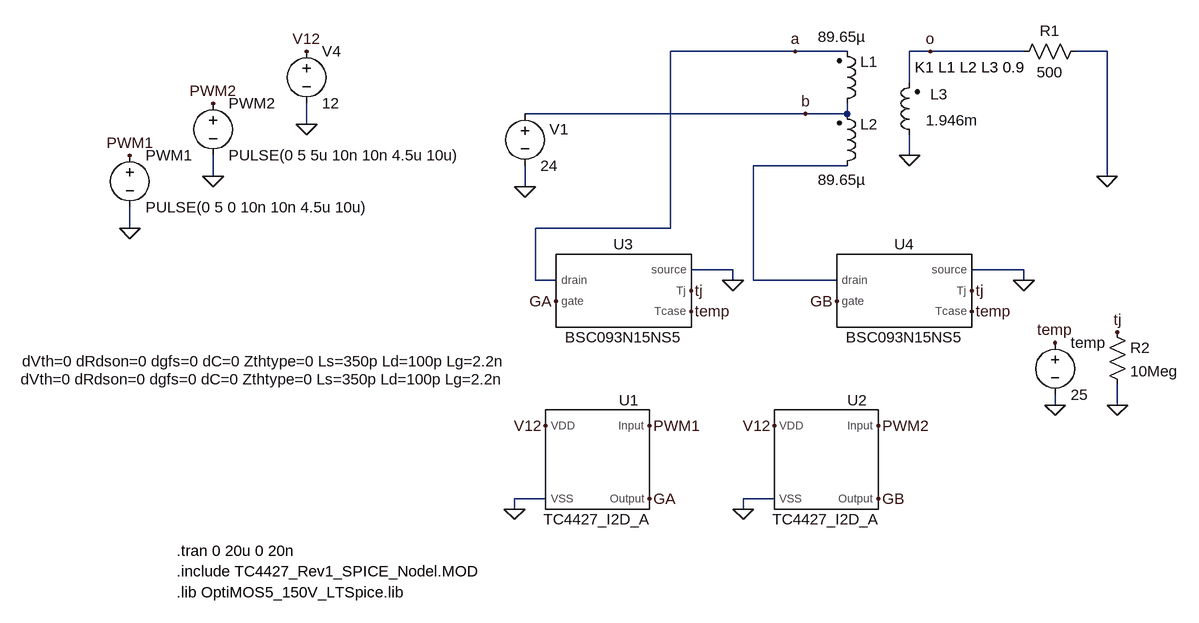
[diagram p0: schematic trafo_simulado.asc]
trafo_simulado.asc, the LTspice schematic file:
Version 4.1
SHEET 1 1352 992
WIRE 384 144 192 144
WIRE 464 144 384 144
WIRE 592 144 560 144
WIRE 736 144 592 144
WIRE 864 144 816 144
WIRE 560 192 560 144
WIRE 400 240 -32 240
WIRE 464 240 464 224
WIRE 464 240 400 240
WIRE -368 256 -368 224
WIRE 560 304 560 272
WIRE 464 320 320 320
WIRE -512 336 -512 304
WIRE 864 336 864 144
WIRE -32 352 -32 320
WIRE -640 416 -640 384
WIRE 192 416 192 144
WIRE 192 416 -16 416
WIRE 288 480 224 480
WIRE 736 480 656 480
WIRE -16 496 -16 416
WIRE 16 496 -16 496
WIRE 288 496 288 480
WIRE 320 496 320 320
WIRE 448 496 320 496
WIRE 736 496 736 480
WIRE 784 688 784 672
WIRE 880 688 880 656
WIRE 0 832 -48 832
WIRE 352 832 304 832
WIRE -48 848 -48 832
WIRE 304 848 304 832
FLAG 864 336 0
FLAG -640 416 0
FLAG -512 336 0
FLAG -32 352 0
FLAG 560 304 0
FLAG -368 256 0
FLAG -640 304 PWM1
FLAG -512 224 PWM2
FLAG 160 720 PWM1
FLAG -368 144 V12
FLAG 0 720 V12
FLAG -48 848 0
FLAG 160 832 GA
FLAG 352 720 V12
FLAG 304 848 0
FLAG 384 144 a
FLAG 400 240 b
FLAG 592 144 o
FLAG 288 496 0
FLAG 16 528 GA
FLAG 512 720 PWM2
FLAG 512 832 GB
FLAG 448 528 GB
FLAG 736 496 0
FLAG 224 512 tj
FLAG 656 512 tj
FLAG 880 576 tj
FLAG 880 688 0
FLAG 784 592 temp
FLAG 224 544 temp
FLAG 656 544 temp
FLAG 784 688 0
DATAFLAG 384 144 "$-V(b)"
SYMBOL ind2 448 240 M180
WINDOW 0 36 80 Left 2
WINDOW 3 -29 119 Left 2
SYMATTR InstName L1
SYMATTR Value 89.65µ
SYMATTR Type ind
SYMATTR SpiceLine Rser=20m
SYMBOL ind2 576 288 R180
WINDOW 0 -43 78 Left 2
WINDOW 3 -90 38 Left 2
SYMATTR InstName L3
SYMATTR Value 1.946m
SYMATTR Type ind
SYMATTR SpiceLine Rser=0.2
SYMBOL voltage -32 224 R0
WINDOW 0 38 40 Left 2
SYMATTR InstName V1
SYMATTR Value 24
SYMBOL ind2 448 336 M180
WINDOW 0 36 80 Left 2
WINDOW 3 -29 -5 Left 2
SYMATTR InstName L2
SYMATTR Value 89.65µ
SYMATTR Type ind
SYMATTR SpiceLine Rser=20m
SYMBOL voltage -640 288 R0
WINDOW 123 0 0 Left 0
WINDOW 39 0 0 Left 0
SYMATTR InstName PWM1
SYMATTR Value PULSE(0 5 0 10n 10n 4.5u 10u)
SYMBOL voltage -512 208 R0
WINDOW 123 0 0 Left 0
WINDOW 39 0 0 Left 0
SYMATTR InstName PWM2
SYMATTR Value PULSE(0 5 5u 10n 10n 4.5u 10u)
SYMBOL res 832 128 R90
WINDOW 0 0 56 VBottom 2
WINDOW 3 32 56 VTop 2
SYMATTR InstName R1
SYMATTR Value 500
SYMBOL voltage -368 128 R0
SYMATTR InstName V4
SYMATTR Value 12
SYMBOL TC4427A 96 768 M0
SYMATTR InstName U1
SYMBOL TC4427A 448 768 M0
SYMATTR InstName U2
SYMBOL BSC093N15NS5 112 512 R0
WINDOW 39 -543 121 Top 2
SYMATTR InstName U3
SYMBOL BSC093N15NS5 544 512 R0
WINDOW 39 -973 93 Top 2
SYMATTR InstName U4
SYMBOL res 864 560 R0
SYMATTR InstName R2
SYMATTR Value 10Meg
SYMBOL voltage 784 576 R0
SYMATTR InstName temp
SYMATTR Value 25
TEXT 568 168 Left 2 !K1 L1 L2 L3 0.9
TEXT -568 912 Left 2 !.tran 0 20u 0 20n
TEXT -568 944 Left 2 !.include TC4427_Rev1_SPICE_Nodel.MOD
TEXT -568 976 Left 2 !.lib OptiMOS5_150V_LTSpice.lib

The netlist it stands for:
* trafo_simulado.asc
L1 b a 89.65µ Rser=20m
L3 0 o 1.946m Rser=0.2
V1 b 0 24
L2 N001 b 89.65µ Rser=20m
V§PWM1 PWM1 0 PULSE(0 5 0 10n 10n 4.5u 10u)
V§PWM2 PWM2 0 PULSE(0 5 5u 10n 10n 4.5u 10u)
R1 0 o 500
V4 V12 0 12
X§U1 PWM1 GA V12 0 TC4427_I2D_A  ; pins Input Output VDD VSS
X§U2 PWM2 GB V12 0 TC4427_I2D_A  ; pins Input Output VDD VSS
X§U3 a GA 0 tj temp BSC093N15NS5 dVth=0 dRdson=0 dgfs=0 dC=0 Zthtype=0 Ls=350p Ld=100p Lg=2.2n  ; pins drain gate source Tj Tcase
X§U4 N001 GB 0 tj temp BSC093N15NS5 dVth=0 dRdson=0 dgfs=0 dC=0 Zthtype=0 Ls=350p Ld=100p Lg=2.2n  ; pins drain gate source Tj Tcase
R2 tj 0 10Meg
V§temp temp 0 25
K1 L1 L2 L3 0.9
.tran 0 20u 0 20n
.include TC4427_Rev1_SPICE_Nodel.MOD
.lib OptiMOS5_150V_LTSpice.lib
.lib TC4427_Rev1_SPICE_Nodel.MOD
.lib OptiMOS5_150V_LTSpice.lib
.backanno
.end